# Altium schematic sheet BUCK2_unvalidated.SchDoc
size A3; SheetNumber: 2; SheetTotal: 2
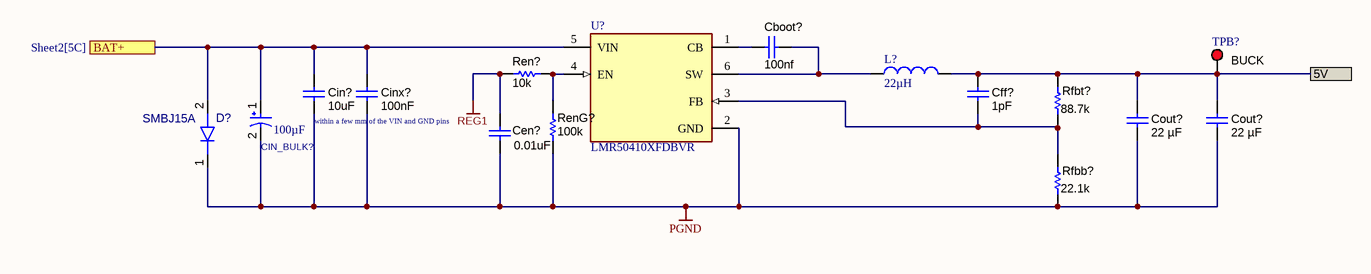
[diagram p0: BUCK2_unvalidated.SchDoc]

## Parts
(Parts that share a designator on the sheet are numbered #1, #2 ... from top to bottom, then left to right.)
Cboot?  ValueDisplayed: 100nf  [0603]  (hidden comment: 885012206095)
Cen?  ValueDisplayed: 0.01uF  [0603]  (hidden comment: 885012206040)
Cff?  ValueDisplayed: 1pF  [0805_HV]  (hidden comment: EMK212B7225KG-T)
Cin?  ValueDisplayed: 10uF  [0805_HV]  (hidden comment: EMK212B7225KG-T)
CIN_BULK?  value 100µF  [CAPPR65-350-1150X800X1250]  (hidden comment: ECA1HM101)
Cinx?  ValueDisplayed: 100nF  [0805_HV]  (hidden comment: EMK212B7225KG-T)
Cout?#1  ValueDisplayed: 22 µF  [0805_HV]  (hidden comment: EMK212B7225KG-T)
Cout?#2  ValueDisplayed: 22 µF  [0805_HV]  (hidden comment: EMK212B7225KG-T)
D?  SMBJ15A
L?  value 22µH  (hidden comment: VLP8040T-220M)
Ren?  ValueDisplayed: 10k  [1206]  (hidden comment: CRCW12065K10JNEA)
RenG?  ValueDisplayed: 100k  [1206]  (hidden comment: CRCW12065K10JNEA)
Rfbb?  ValueDisplayed: 22.1k  [0603]  (hidden comment: Resistor)
Rfbt?  ValueDisplayed: 88.7k  [0603]  (hidden comment: Resistor)
TPB?  TESTPOINT  [Keystone5010]  (value not drawn)
U?  LMR50410XFDBVR  [FP-DBV0006A-IPC_B]

## Ports
5V, BAT+ (see Sheet2[5C])

## Nets
PGND: Cen?.2 Cin?.1 CIN_BULK?.2 Cinx?.1 Cout?#1.1 Cout?#2.1 D?.1(K) RenG?.1 Rfbb?.2 U?.2(GND)
REG1: Cen?.1 Ren?.2
5V: Cff?.2 Cout?#1.2 Cout?#2.2 L?.2 Rfbt?.1 TPB?.1 ; port 5V
BAT+: Cin?.2 CIN_BULK?.1 Cinx?.2 D?.2(A) U?.5(VIN) ; port BAT+
NetCboot?_1: Cboot?.1 U?.1(CB)
NetCboot?_2: Cboot?.2 L?.1 U?.6(SW)
NetCff?_1: Cff?.1 Rfbb?.1 Rfbt?.2 U?.3(FB)
NetRen?_1: Ren?.1 RenG?.2 U?.4(EN)

## Notes on the sheet
- (near TPB?) BUCK
- within a few mm of the VIN and GND pins

## Library data of the parts
Cboot? = CMP-0006837-4: Cap = 100 nF / Total Derated Cap = 100 nF / VDC = 16 V / ESR = 1 mΩ / Package = 0402; Manufacturer: Wurth Elektronik; TaMin_C: -55°C; Polarized: N; TempCo: X7R; SizeAreaWB_mm2: 4.68; Value1: Unknown; U/M: EA; Value: 0.1uF; TaMax_C: 125°C; Tolerance_%: 10%; SizeZ_mm: 1; SizeX_mm: 1.6; SizeY_mm: 0.8; Value2: 50V; SizeArea_mm2: 1.28; AEC Category: Q200; Publisher: Texas Instruments; Published: 2008-06-19; RoHS: Y; MountType: SMT; PackageReference: 0603; Cap_Case: 0603; CompType: Capacitor; LatestRevisionDate: 2017-03-09; PartNumber: 885012206095; AEC Qualified: N; Cap_F: 100nF; ComponentLink1Description: Datasheet link; AEC Grade: N/A; Technology: Ceramic; ComponentLink1URL: http://katalog.we-online.de/pbs/datasheet/885012206095.pdf
Cen? = CMP-0006828-4: CAP, CERM, 0.01 uF, 16 V, +/- 10%, X7R, 0603; Manufacturer: Wurth Elektronik; TaMin_C: -55°C; Polarized: N; SizeAreaWB_mm2: 4.68; Value1: Unknown; U/M: EA; Value: 0.01uF; TaMax_C: 125°C; SizeZ_mm: 1; SizeX_mm: 1.6; SizeY_mm: 0.8; Value2: 16V; SizeArea_mm2: 1.28; Cap_F: 10nF; AEC Category: Q200; Supplier Part Number 2: 710-885012206040; Publisher: Texas Instruments; Supplier 2: Mouser; TempCo: X7R; Published: 2008-06-19; RoHS: Y; MountType: SMT; Supplier 1: Digi-Key; PackageReference: 0603; Tolerance_%: 10%; Cap_Case: 0603; CompType: Capacitor; LatestRevisionDate: 2017-03-09; PartNumber: 885012206040; AEC Qualified: N; VDC_V: 16V; ComponentLink1Description: Datasheet link; AEC Grade: N/A; Supplier Part Number 1: 732-7959-1-ND; Technology: Ceramic; ComponentLink1URL: http://katalog.we-online.de/pbs/datasheet/885012206040.pdf
Cff? = CMP-0008001-2: Cap = 1 pF / Total Derated Cap = 1 pF / VDC = 50 V / ESR = 1 mΩ / Package = 0402; Manufacturer: Taiyo Yuden; TaMin_C: -55°C; Polarized: N; TempCo: X7R; SizeAreaWB_mm2: 6.75; Value1: Unknown; U/M: EA; Value: 2.2uF; TaMax_C: 125°C; Tolerance_%: 10%; SizeZ_mm: 1.45; SizeX_mm: 2; SizeY_mm: 1.25; Cap_Case: 0805; Value2: 16V; SizeArea_mm2: 2.5; Cap_F: 2.2µF; AEC Category: Q200; Supplier Part Number 2: 1683654; Publisher: Texas Instruments; Supplier 2: Farnell; Published: 2008-06-19; RoHS: Y; MountType: SMT; Supplier 1: Digi-Key; PackageReference: 0805; CompType: Capacitor; LatestRevisionDate: 2017-03-09; PartNumber: EMK212B7225KG-T; AEC Qualified: ?; VDC_V: 16V; ComponentLink1Description: Datasheet link; Supplier Part Number 1: 587-1431-1-ND; Technology: Ceramic; ComponentLink1URL: http://www.yuden.co.jp/ut/product/pdf/djmk_e.pdf
Cin? = CMP-0008001-2: Cap = 10 µF X5R / Total Derated Cap = 1 µF / VDC = 25 V / ESR = 4.64 mΩ / Package = 0603; Manufacturer: Taiyo Yuden; TaMin_C: -55°C; Polarized: N; TempCo: X7R; SizeAreaWB_mm2: 6.75; Value1: Unknown; U/M: EA; Value: 2.2uF; TaMax_C: 125°C; Tolerance_%: 10%; SizeZ_mm: 1.45; SizeX_mm: 2; SizeY_mm: 1.25; Cap_Case: 0805; Value2: 16V; SizeArea_mm2: 2.5; Cap_F: 2.2µF; AEC Category: Q200; Supplier Part Number 2: 1683654; Publisher: Texas Instruments; Supplier 2: Farnell; Published: 2008-06-19; RoHS: Y; MountType: SMT; Supplier 1: Digi-Key; PackageReference: 0805; CompType: Capacitor; LatestRevisionDate: 2017-03-09; PartNumber: EMK212B7225KG-T; AEC Qualified: ?; VDC_V: 16V; ComponentLink1Description: Datasheet link; Supplier Part Number 1: 587-1431-1-ND; Technology: Ceramic; ComponentLink1URL: http://www.yuden.co.jp/ut/product/pdf/djmk_e.pdf
CIN_BULK? = CMP-001-00026-7: Aluminum Electrolytic Capacitor, 100 µF, 25 V, low-ESR electrolytic; Manufacturer: Panasonic; Voltage Rating: 50V; Ripple Current: 250mA; Tolerance: 20%; Datasheet URL: https://industrial.panasonic.com/cdbs/www-data/pdf/RDF0000/ABA0000C1218.pdf; Lead Pitch: 3.5mm; Mounting Technology: TH; Package Description: 2-Pin Radial Lead, Dia 8 mm, Height 12.5 mm; Diameter: 8mm; Ripple Current (AC): 250mA; Manufacturer URL: http://www.panasonic.com/; Capacitor Type: Electrolytic; Max Operating Temperature: 85°C; Pins: 2; Min Operating Temperature: -40°C; Case/Package: Radial; Packaging: Bulk; Package Quantity: 200; Package Reference: CAPPR65-350-1150X800X1250; RoHS Compliant: True; Datasheet Version: Rev. 05, 10/2016
Cinx? = CMP-0008001-2: Cap = 100 nF / Total Derated Cap = 100 nF / VDC = 18.9 V / ESR = 1 µΩ; Manufacturer: Taiyo Yuden; TaMin_C: -55°C; Polarized: N; TempCo: X7R; SizeAreaWB_mm2: 6.75; Value1: Unknown; U/M: EA; Value: 2.2uF; TaMax_C: 125°C; Tolerance_%: 10%; SizeZ_mm: 1.45; SizeX_mm: 2; SizeY_mm: 1.25; Cap_Case: 0805; Value2: 16V; SizeArea_mm2: 2.5; Cap_F: 2.2µF; AEC Category: Q200; Supplier Part Number 2: 1683654; Publisher: Texas Instruments; Supplier 2: Farnell; Published: 2008-06-19; RoHS: Y; MountType: SMT; Supplier 1: Digi-Key; PackageReference: 0805; CompType: Capacitor; LatestRevisionDate: 2017-03-09; PartNumber: EMK212B7225KG-T; AEC Qualified: ?; VDC_V: 16V; ComponentLink1Description: Datasheet link; Supplier Part Number 1: 587-1431-1-ND; Technology: Ceramic; ComponentLink1URL: http://www.yuden.co.jp/ut/product/pdf/djmk_e.pdf
Cout?#1 Cout?#2 = CMP-0008001-2: Cap = 22 µF / Total Derated Cap = 20 µF / VDC = 10 V / ESR = 3 mΩ / Package = 0805; Manufacturer: Taiyo Yuden; TaMin_C: -55°C; Polarized: N; TempCo: X7R; SizeAreaWB_mm2: 6.75; Value1: Unknown; U/M: EA; Value: 2.2uF; TaMax_C: 125°C; Tolerance_%: 10%; SizeZ_mm: 1.45; SizeX_mm: 2; SizeY_mm: 1.25; Cap_Case: 0805; Value2: 16V; SizeArea_mm2: 2.5; Cap_F: 2.2µF; AEC Category: Q200; Supplier Part Number 2: 1683654; Publisher: Texas Instruments; Supplier 2: Farnell; Published: 2008-06-19; RoHS: Y; MountType: SMT; Supplier 1: Digi-Key; PackageReference: 0805; CompType: Capacitor; LatestRevisionDate: 2017-03-09; PartNumber: EMK212B7225KG-T; AEC Qualified: ?; VDC_V: 16V; ComponentLink1Description: Datasheet link; Supplier Part Number 1: 587-1431-1-ND; Technology: Ceramic; ComponentLink1URL: http://www.yuden.co.jp/ut/product/pdf/djmk_e.pdf
D? = CMP-004-00031-1: TVS Diode, SMBJ, Unidirectional, 15 V, 24.4 V, DO-214AA (SMB), 2 Pins; Breakdown Voltage: 17.6V; Number of Channels: 1; Max Surge Current: 100A; Peak Pulse Power: 600W; Power Line Protection: No; Max Junction Temperature (Tj): 150°C; Peak Pulse Current: 24.6A; Max Power Dissipation: 5W; Max Breakdown Voltage: 18.5V; Leakage Current: 5µA; Min Breakdown Voltage: 16.7V; Test Current: 1mA; Reverse Standoff Voltage: 15V; Clamping Voltage: 24.4V; Element Configuration: Single; ESD Protection: Yes; Composition: Zener; Polarity: Unidirectional; Mounting Technology: Surface Mount; REACH SVHC: No; Country of Origin: Taiwan; China RoHS: Non-Compliant; Radiation Hardening: No; Length: 4.57mm; Max Operating Temperature: 150°C; Schedule B: 8541100080; Width: 3.94mm; Packaging: Tape & Reel; Harmonized Tariff Schedule (HTS) Code: 8541.10.00.50; Height: 2.44mm; Number of Terminals: 2; Direction: Unidirectional; Introduction Date: 2010-02-23; Power Rating: 600W; Reverse Breakdown Voltage: 16.7V; RoHS: Compliant; Lifecycle Status: Production; Number of Elements: 1; Min Operating Temperature: -55°C; Number of Unidirectional Channels: 1; Pins: 2; Termination: SMD/SMT; Max Reverse Leakage Current: 5µA; Case/Package: SMB; Export Control Classification Number (ECCN) Code: EAR99
L? = CMP-006-00021-1: Inductor Power Shielded Wirewound 22uH 20% 100KHz Ferrite 2.5A 75mOhm DCR Embossed Carrier T/R; Manufacturer Lifecycle Status: OBSOLETE; Number of Circuits: 1; DC Resistance (DCR): 75mΩ; Shielding: Yes; Saturation Current: 2.2A; Number of Terminals: 2; Military Standard: Not; Max Width: 8.7mm; Test Frequency: 100kHz; Max Operating Temperature: 105°C; Length: 8.6mm; Height: 4mm; Mounting Technology: Surface Mount; Max Length: 8.6mm; Lead Free: Lead Free; Lifecycle Status: Obsolete; RMS Current (Irms): 2.5A; RoHS: Compliant; Core Material: Ferrite; Current Rating: 2.5A; Width: 8mm; Height - Seated (Max): 3.9878mm; Inductance Tolerance: 20%; Depth: 8.7mm; Max DC Current: 2.2A; Composition: Wirewound; Export Control Classification Number (ECCN) Code: EAR99; Min Operating Temperature: -40°C; Introduction Date: 2010-02-22; REACH SVHC: Yes; Harmonized Tariff Schedule (HTS) Code: 8504.50.80.00; Max Current Rating: 2.5A; Tolerance: 20%; Termination: SMD/SMT; Case/Package: 8040
Ren? = CMP-0018703-3: RES, 10 k, 5%, 0.1 W, AEC-Q200 Grade 0, 0603; Manufacturer: Vishay-Dale; Value: 5.1k; Value_Code: 5k10; Power_W: 250mW; Value2: 0.25W; VDC_V: 200V; TempCo: 200 ppm/C; SizeArea_mm2: 5.12; SizeX_mm: 3.2; SizeY_mm: 1.6; SizeZ_mm: 1.35; EIA_Code: E24; AEC Category: Q200; AEC Qualified: Y; AEC Grade: 0; CompType: Resistor; PartNumber: CRCW12065K10JNEA; PackageReference: 1206; RoHS: E; Res_ohm: 5.1k; Tolerance_%: 5%; Value1: 5%; MountType: SMT; Technology: Thick Film; ComponentLink1Description: Datasheet link; ComponentLink1URL: http://www.vishay.com/docs/20035/dcrcwe3.pdf; Supplier 1: Digi-Key; Supplier Part Number 1: 541-5.1KECT-ND; Supplier 2: Newark; Supplier Part Number 2: 59M8589; Supplier 3: Mouser; Supplier Part Number 3: 71-CRCW1206J-5.1K-E3
RenG? = CMP-0018703-3: RES, 100 k, 5%, 0.1 W, AEC-Q200 Grade 0, 0603; Manufacturer: Vishay-Dale; Value: 5.1k; Value_Code: 5k10; Power_W: 250mW; Value2: 0.25W; VDC_V: 200V; TempCo: 200 ppm/C; SizeArea_mm2: 5.12; SizeX_mm: 3.2; SizeY_mm: 1.6; SizeZ_mm: 1.35; EIA_Code: E24; AEC Category: Q200; AEC Qualified: Y; AEC Grade: 0; CompType: Resistor; PartNumber: CRCW12065K10JNEA; PackageReference: 1206; RoHS: E; Res_ohm: 5.1k; Tolerance_%: 5%; Value1: 5%; MountType: SMT; Technology: Thick Film; ComponentLink1Description: Datasheet link; ComponentLink1URL: http://www.vishay.com/docs/20035/dcrcwe3.pdf; Supplier 1: Digi-Key; Supplier Part Number 1: 541-5.1KECT-ND; Supplier 2: Newark; Supplier Part Number 2: 59M8589; Supplier 3: Mouser; Supplier Part Number 3: 71-CRCW1206J-5.1K-E3
Rfbb? = CMP-0025701-4: Resistance = 22.1 kΩ / Tolerance = 1.0% / Power = 63 mW; PartNumber: CRCW060310K0JNEA; Manufacturer: Vishay-Dale; Value: 10k; Value_Code: 10k0; Tolerance_%: 5%; Power_W: 100mW; Value2: 0.1W; VDC_V: 75V; TempCo: 200 ppm/C; EIA_Code: E24; U/M: EA; SizeArea_mm2: 1.28; SizeX_mm: 1.6; SizeY_mm: 0.8; SizeZ_mm: 1; AEC Category: Q200; AEC Qualified: Y; AEC Grade: 0; CompType: Resistor; SymbolVersion: 2009-05-29; PackageReference: 0603; RoHS: E; Res_ohm: 10k; Value1: 5%; MountType: SMT; Technology: Thick Film; Published: 2008-06-26; Publisher: Texas Instruments; LatestRevisionDate: 2017-06-13; ComponentLink1Description: Datasheet link; ComponentLink1URL: http://www.vishay.com/docs/20035/dcrcwe3.pdf; Supplier 1: Digi-Key; Supplier Part Number 1: 541-10KGCT-ND; Supplier 2: Newark; Supplier Part Number 2: 52K8066; Supplier 3: Mouser; Supplier Part Number 3: 71-CRCW0603J-10K-E3
Rfbt? = CMP-0025701-4: Resistance = 88.7 kΩ / Tolerance = 1.0% / Power = 63 mW; PartNumber: CRCW060310K0JNEA; Manufacturer: Vishay-Dale; Value: 10k; Value_Code: 10k0; Tolerance_%: 5%; Power_W: 100mW; Value2: 0.1W; VDC_V: 75V; TempCo: 200 ppm/C; EIA_Code: E24; U/M: EA; SizeArea_mm2: 1.28; SizeX_mm: 1.6; SizeY_mm: 0.8; SizeZ_mm: 1; AEC Category: Q200; AEC Qualified: Y; AEC Grade: 0; CompType: Resistor; SymbolVersion: 2009-05-29; PackageReference: 0603; RoHS: E; Res_ohm: 10k; Value1: 5%; MountType: SMT; Technology: Thick Film; Published: 2008-06-26; Publisher: Texas Instruments; LatestRevisionDate: 2017-06-13; ComponentLink1Description: Datasheet link; ComponentLink1URL: http://www.vishay.com/docs/20035/dcrcwe3.pdf; Supplier 1: Digi-Key; Supplier Part Number 1: 541-10KGCT-ND; Supplier 2: Newark; Supplier Part Number 2: 52K8066; Supplier 3: Mouser; Supplier Part Number 3: 71-CRCW0603J-10K-E3
TPB? = CMP-0055147-1: Test Point, Multipurpose, Red, TH; Manufacturer: Keystone; CNHeader: FALSE; Green_Lifecycle: Active; Green_REACh: Passed; ContactFinish: Silver; CT: TRUE; CompType: Test Point; PackageReference: Red Multipurpose Testpoint; PartNumber: 5010; ComponentLink1URL: http://www.keyelco.com/userAssets/file/M60-2p60.pdf; Supplier Part Number 2: 534-5010; Publisher: Texas Instruments; Supplier 2: Mouser; Color: Red; RoHS: Y; MountType: TH; Green_EU RoHS-2: Incomplete; Supplier 1: Digi-Key; Green_EU RoHS: Passed; LatestRevisionDate: 26/05/2017; ComponentLink1Description: Datasheet URL; Supplier Part Number 1: 36-5010-ND
U? = CMP-019-00050-1: IC REG BUCK ADJ 1A SOT23-6 Buck Switching Regulator IC Positive Adjustable 1V 1 Output 1A SOT-23-6; Manufacturer Lifecycle Status: ACTIVE; Min Supply Voltage: 4V; Max Junction Temperature (Tj): 150°C; Switching Frequency: 700kHz; Nominal Supply Current: 80µA; Number of Channels: 1; Max Supply Voltage: 36V; Max Duty Cycle: 98%; Length: 2.9mm; Case/Package: SOT-23; Width: 1.6mm; Min Operating Temperature: -40°C; Height: 0m; Pins: 6; Schedule B: 8542390000; Lifecycle Status: Production; Topology: Buck; Output Current: 1A; Number of Outputs: 1; Max Operating Temperature: 150°C; RoHS: Compliant; Thickness: 1.2mm